# Altium schematic sheet DXES101B-659637-DIGITAL-OUTPUTS.SchDoc: DXES100
size A3; Organization: Altium Limited; Address1: 3 Minna Close; Address2: Belrose; Address3: NSW 2085; Address4: Australia; SheetNumber: 3; SheetTotal: 10
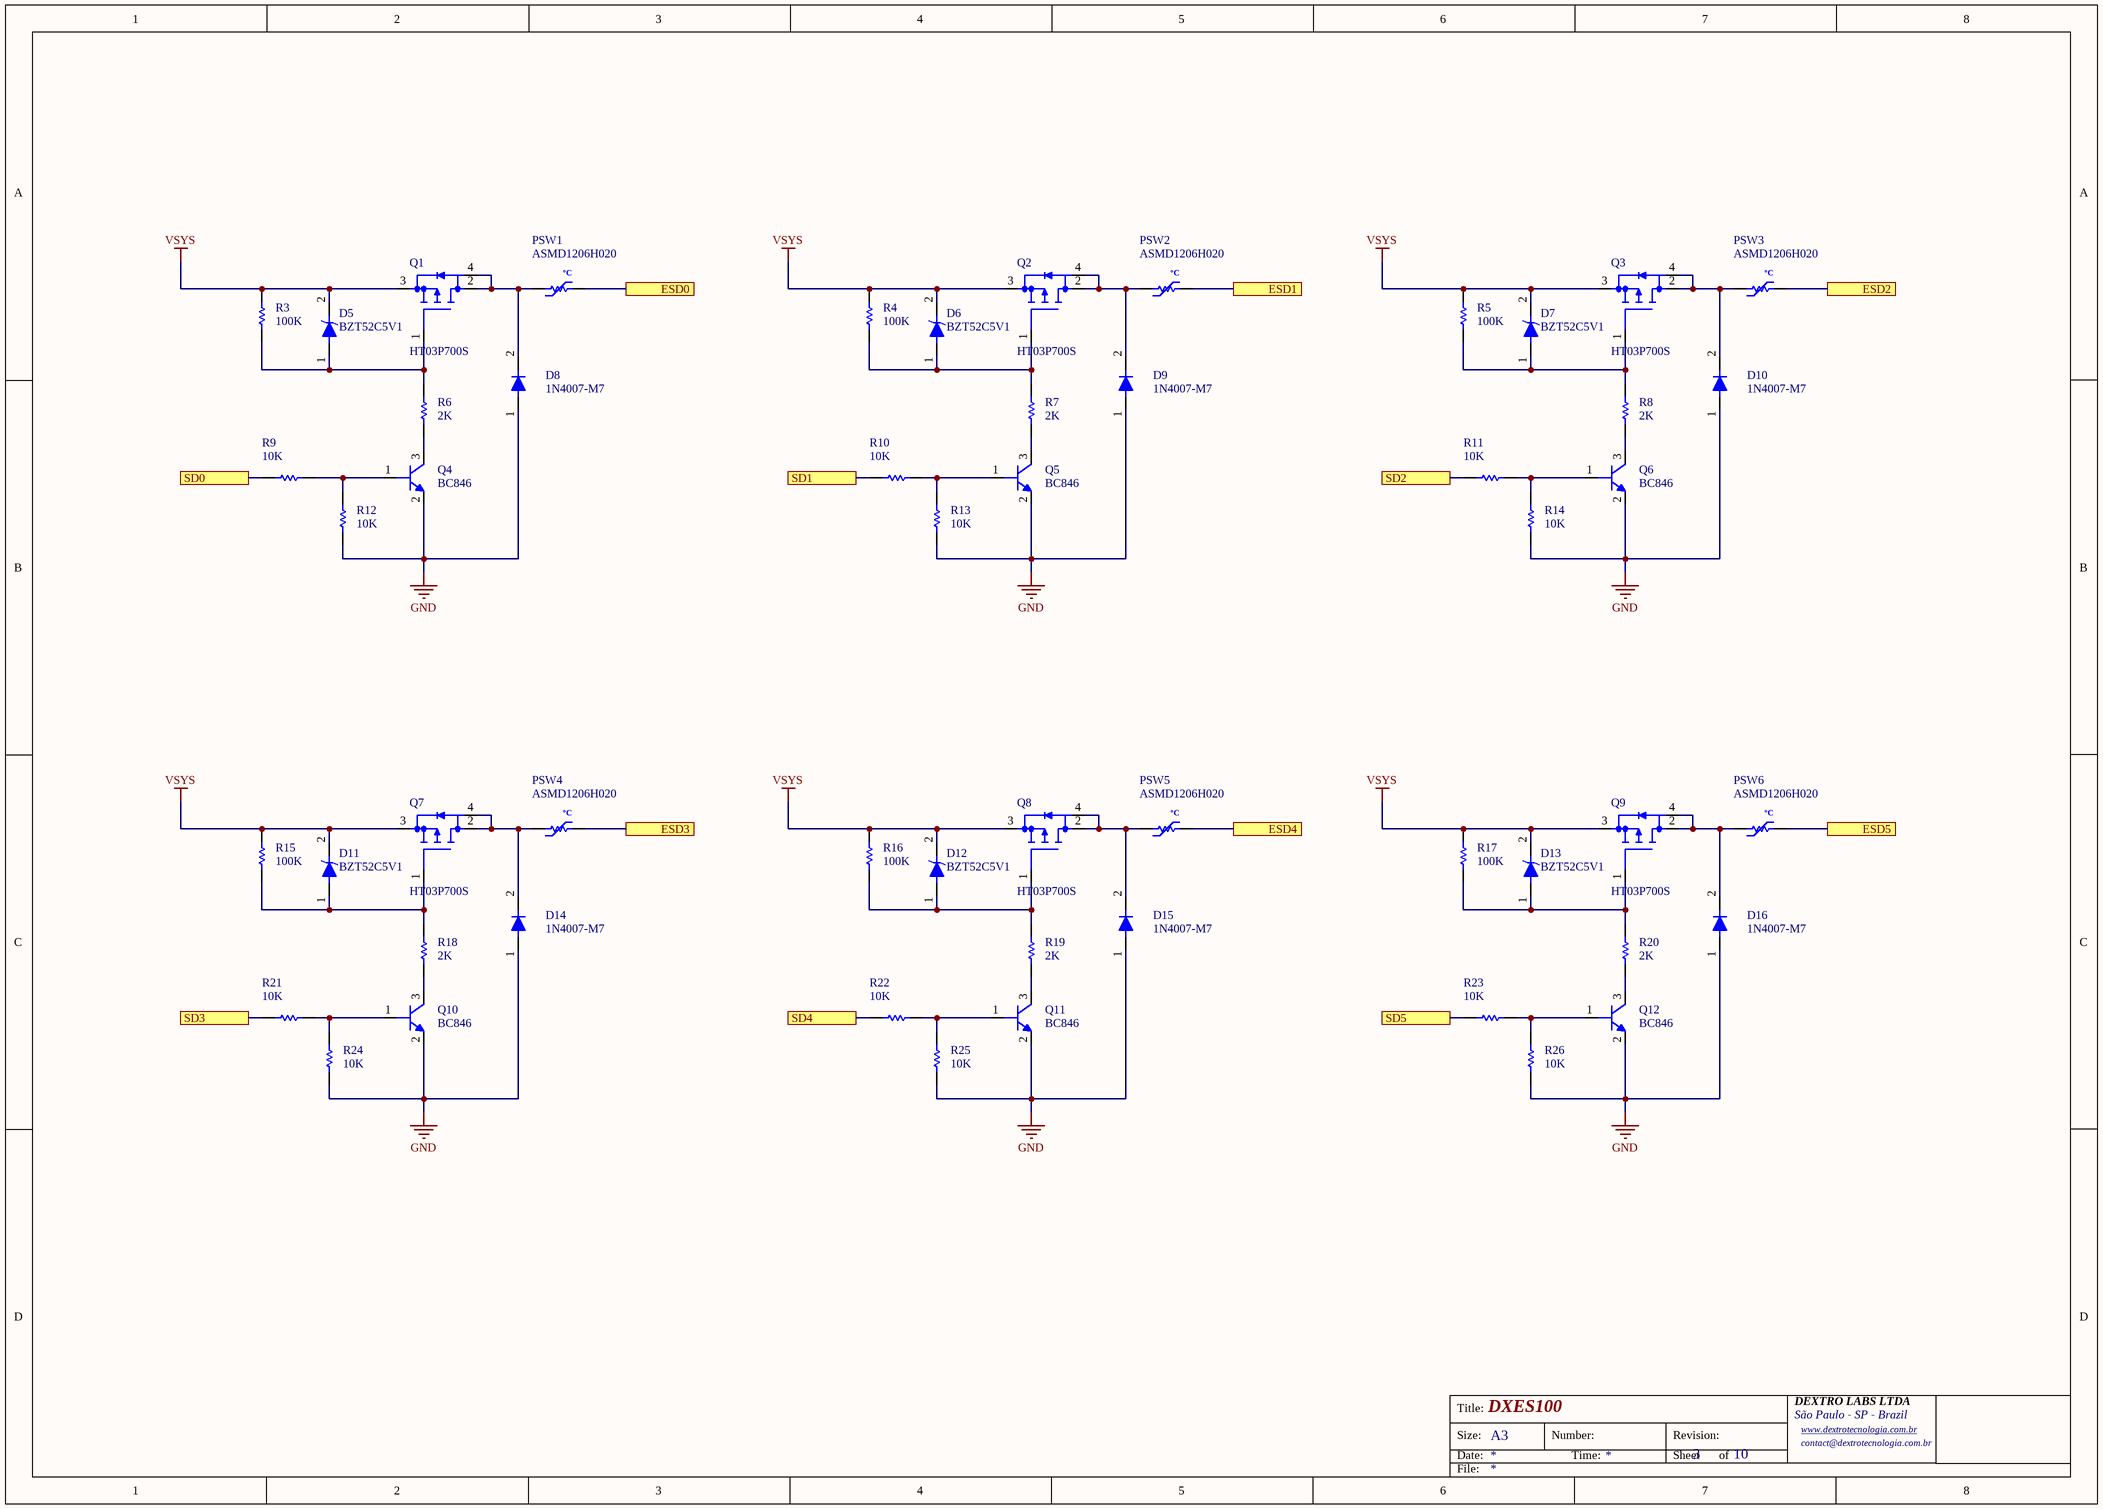
[diagram p0: DXES101B-659637-DIGITAL-OUTPUTS.SchDoc]

## Parts
D5  BZT52C5V1  [SOD123]
D6  BZT52C5V1  [SOD123]
D7  BZT52C5V1  [SOD123]
D8  1N4007-M7  [SMA]
D9  1N4007-M7  [SMA]
D10  1N4007-M7  [SMA]
D11  BZT52C5V1  [SOD123]
D12  BZT52C5V1  [SOD123]
D13  BZT52C5V1  [SOD123]
D14  1N4007-M7  [SMA]
D15  1N4007-M7  [SMA]
D16  1N4007-M7  [SMA]
PSW1  ASMD1206H020  [PTC-1206]
PSW2  ASMD1206H020  [PTC-1206]
PSW3  ASMD1206H020  [PTC-1206]
PSW4  ASMD1206H020  [PTC-1206]
PSW5  ASMD1206H020  [PTC-1206]
PSW6  ASMD1206H020  [PTC-1206]
Q1  HT03P700S  [SOT-223-3_L6.7-W3.7-P2.30-LS7.0-BR_2]
Q2  HT03P700S  [SOT-223-3_L6.7-W3.7-P2.30-LS7.0-BR_2]
Q3  HT03P700S  [SOT-223-3_L6.7-W3.7-P2.30-LS7.0-BR_2]
Q4  BC846  [SOT23-3]
Q5  BC846  [SOT23-3]
Q6  BC846  [SOT23-3]
Q7  HT03P700S  [SOT-223-3_L6.7-W3.7-P2.30-LS7.0-BR_2]
Q8  HT03P700S  [SOT-223-3_L6.7-W3.7-P2.30-LS7.0-BR_2]
Q9  HT03P700S  [SOT-223-3_L6.7-W3.7-P2.30-LS7.0-BR_2]
Q10  BC846  [SOT23-3]
Q11  BC846  [SOT23-3]
Q12  BC846  [SOT23-3]
R3  100K  [RES-0603]
R4  100K  [RES-0603]
R5  100K  [RES-0603]
R6  2K  [RES-1206]
R7  2K  [RES-1206]
R8  2K  [RES-1206]
R9  10K  [RES-0603]
R10  10K  [RES-0603]
R11  10K  [RES-0603]
R12  10K  [RES-0603]
R13  10K  [RES-0603]
R14  10K  [RES-0603]
R15  100K  [RES-0603]
R16  100K  [RES-0603]
R17  100K  [RES-0603]
R18  2K  [RES-1206]
R19  2K  [RES-1206]
R20  2K  [RES-1206]
R21  10K  [RES-0603]
R22  10K  [RES-0603]
R23  10K  [RES-0603]
R24  10K  [RES-0603]
R25  10K  [RES-0603]
R26  10K  [RES-0603]

## Ports
ESD0 (see DXES101B-659637-GENERAL[4A]), ESD1 (see DXES101B-659637-GENERAL[4A]), ESD2 (see DXES101B-659637-GENERAL[4A]), ESD3 (see DXES101B-659637-GENERAL[4A]), ESD4 (see DXES101B-659637-GENERAL[4A]), ESD5 (see DXES101B-659637-GENERAL[4A]), SD0 (see DXES101B-659637-GENERAL[3A], DXES101B-659637-POWER-AND-SIGNALS[2C]), SD1 (see DXES101B-659637-GENERAL[3A], DXES101B-659637-POWER-AND-SIGNALS[3C]), SD2 (see DXES101B-659637-GENERAL[3A], DXES101B-659637-POWER-AND-SIGNALS[2C]), SD3 (see DXES101B-659637-GENERAL[3A], DXES101B-659637-POWER-AND-SIGNALS[3C]), SD4 (see DXES101B-659637-GENERAL[3A], DXES101B-659637-POWER-AND-SIGNALS[2C]), SD5 (see DXES101B-659637-GENERAL[3A], DXES101B-659637-POWER-AND-SIGNALS[3C])

## Nets
GND: D8.1(A1) D9.1(A1) D10.1(A1) D14.1(A1) D15.1(A1) D16.1(A1) Q4.2 Q5.2 Q6.2 Q10.2 Q11.2 Q12.2 R12.1 R13.1 R14.1 R24.1 R25.1 R26.1
VSYS: D5.2(K) D6.2(K) D7.2(K) D11.2(K) D12.2(K) D13.2(K) Q1.3(S) Q2.3(S) Q3.3(S) Q7.3(S) Q8.3(S) Q9.3(S) R3.2 R4.2 R5.2 R15.2 R16.2 R17.2
ESD0: PSW1.2 ; port ESD0
ESD1: PSW2.2 ; port ESD1
ESD2: PSW3.2 ; port ESD2
ESD3: PSW4.2 ; port ESD3
ESD4: PSW5.2 ; port ESD4
ESD5: PSW6.2 ; port ESD5
SD0: R9.2 ; port SD0
SD1: R10.2 ; port SD1
SD2: R11.2 ; port SD2
SD3: R21.2 ; port SD3
SD4: R22.2 ; port SD4
SD5: R23.2 ; port SD5
NetD5_1: D5.1(A1) Q1.1(G]) R3.1 R6.2
NetD6_1: D6.1(A1) Q2.1(G]) R4.1 R7.2
NetD7_1: D7.1(A1) Q3.1(G]) R5.1 R8.2
NetD8_2: D8.2(K) PSW1.1 Q1.2(D) Q1.4(D)
NetD9_2: D9.2(K) PSW2.1 Q2.2(D) Q2.4(D)
NetD10_2: D10.2(K) PSW3.1 Q3.2(D) Q3.4(D)
NetD11_1: D11.1(A1) Q7.1(G]) R15.1 R18.2
NetD12_1: D12.1(A1) Q8.1(G]) R16.1 R19.2
NetD13_1: D13.1(A1) Q9.1(G]) R17.1 R20.2
NetD14_2: D14.2(K) PSW4.1 Q7.2(D) Q7.4(D)
NetD15_2: D15.2(K) PSW5.1 Q8.2(D) Q8.4(D)
NetD16_2: D16.2(K) PSW6.1 Q9.2(D) Q9.4(D)
NetQ4_1: Q4.1 R9.1 R12.2
NetQ4_3: Q4.3 R6.1
NetQ5_1: Q5.1 R10.1 R13.2
NetQ5_3: Q5.3 R7.1
NetQ6_1: Q6.1 R11.1 R14.2
NetQ6_3: Q6.3 R8.1
NetQ10_1: Q10.1 R21.1 R24.2
NetQ10_3: Q10.3 R18.1
NetQ11_1: Q11.1 R22.1 R25.2
NetQ11_3: Q11.3 R19.1
NetQ12_1: Q12.1 R23.1 R26.2
NetQ12_3: Q12.3 R20.1

## Notes on the sheet
- Title:
- Size:
- Date:
- A3
- Number:
- Time:
- Revision:
- Sheet
- of
- DEXTRO LABS LTDA
- São Paulo - SP - Brazil
- www.dextrotecnologia.com.br <http://www.dextrotecnologia.com.br>
- contact@dextrotecnologia.com.br
- File:
- (in symbol ASMD1206H020) ºC

## Library data of the parts
D5-D7 D11-D13 = BZT52C5V1: DIODE-ZENER-5V1-500mV
D8-D10 D14-D16 = 1N4007-M7: C20754788; LCSC: C20754788
PSW1-PSW6 = ASMD1206H020: PTC RESET FUSE 30V 200mA 1206
Q1-Q3 Q7-Q9 = HT03P700S: MOSFET P-CH 30V 6A SOT-223; LCSC: C49066900
Q4-Q6 Q10-Q12 = TRANSISTOR-BC846B,215-SOT23: 65V 200@10mA,5V 250mW 100mA NPN SOT-23 Bipolar (BJT) ROHS; LCSC: C87062
R3-R5 R15-R17 = RES-100K-1%-100mW-0603: 100mW Thick Film Resistor 75V ±100ppm/℃ ±1% 100kΩ 0603 Chip Resistor - Surface Mount ROHS; LCSC: C14675
R6-R8 R18-R20 = RES-2K-1%-250mW-1206: 250mW Thick Film Resistor 200V ±100ppm/℃ ±5% 2kΩ 1206 Chip Resistor - Surface Mount ROHS; LCSC: C2907466
R9-R14 R21-R26 = RES-10K-1%-100mW-0603: 100mW Thick Film Resistor 75V ±100ppm/℃ ±1% 10kΩ 0603 Chip Resistor - Surface Mount ROHS; LCSC: C98220